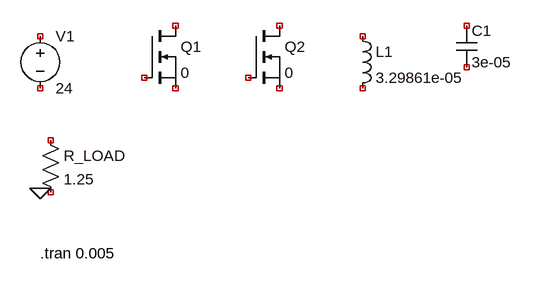
[diagram p0: schematic buck_schematic.asc]
buck_schematic.asc, the LTspice schematic file:
Version 4
SHEET 1 1200 800
SYMBOL voltage 100 100 R0
SYMATTR InstName V1
SYMATTR Value 24
SYMBOL nmos 260 100 R0
SYMATTR InstName Q1
SYMATTR Value 0
SYMBOL nmos 420 100 R0
SYMATTR InstName Q2
SYMATTR Value 0
SYMBOL ind 580 100 R0
SYMATTR InstName L1
SYMATTR Value 3.29861e-05
SYMBOL cap 740 100 R0
SYMATTR InstName C1
SYMATTR Value 3e-05
SYMBOL res 100 260 R0
SYMATTR InstName R_LOAD
SYMATTR Value 1.25
FLAG 100 350 0
TEXT 100 450 Left 2 !.tran 0.005

The netlist it stands for:
* buck_schematic.asc
V1 NC_01 NC_02 24
M§Q1 NC_03 NC_04 NC_05 NC_05 0
M§Q2 NC_06 NC_07 NC_08 NC_08 0
L1 NC_09 NC_10 3.29861e-05
C1 NC_11 NC_12 3e-05
R_LOAD NC_13 NC_14 1.25
.model NMOS NMOS
.model PMOS PMOS
.lib standard.mos
.tran 0.005
.backanno
.end